# Altium schematic sheet Controller_Sheet.SchDoc
size 420 x 297 mm; SheetNumber: 6; SheetTotal: 6
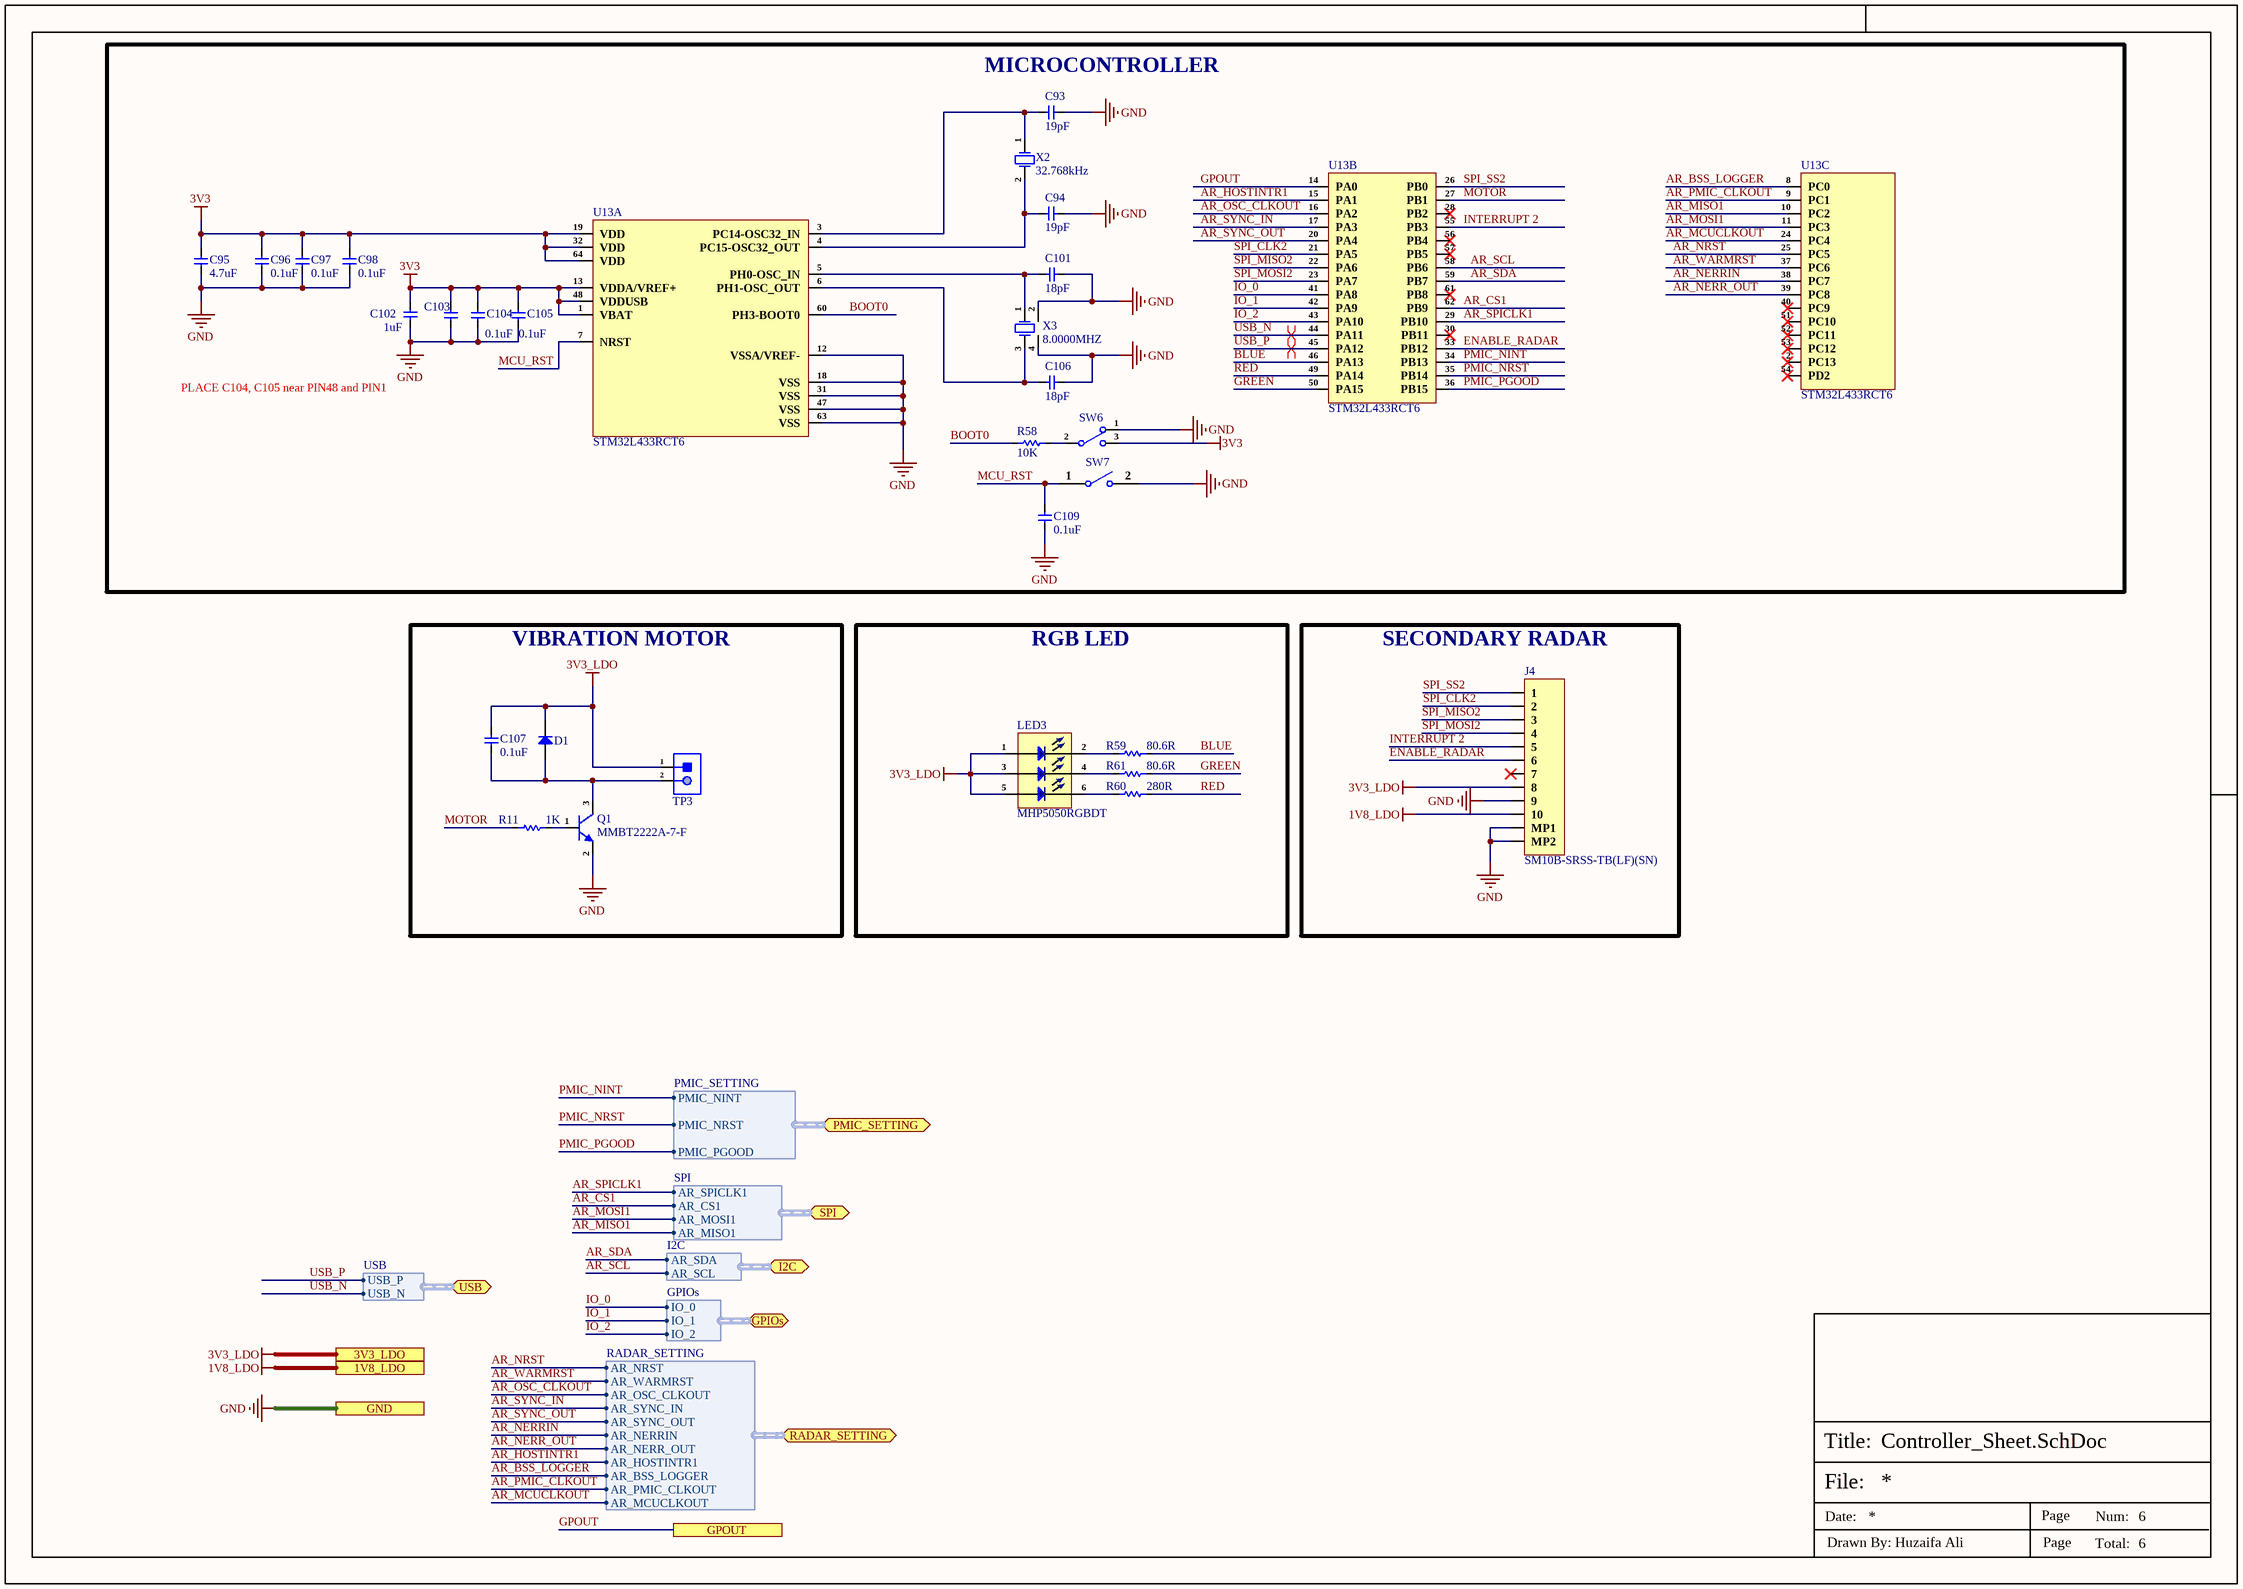
[diagram p0: Controller_Sheet.SchDoc]

## Parts
C93  19pF  [Cap-0402]
C94  19pF  [Cap-0402]
C95  4.7uF  [Cap-0603]
C96  0.1uF  [Cap-0402]
C97  0.1uF  [Cap-0402]
C98  0.1uF  [Cap-0402]
C101  18pF  [CAP-0201]
C102  1uF  [Cap-0402]
C103  10nF  [Cap-0402]  (value not drawn)
C104  0.1uF  [Cap-0402]
C105  0.1uF  [Cap-0402]
C106  18pF  [CAP-0201]
C107  0.1uF  [Cap-0402]
C109  0.1uF  [Cap-0402]
D1  1N4001  [SMA(DO-214AC)]  (value not drawn)
J4  SM10B-SRSS-TB(LF)(SN)  [SM10B-SRSS-TB(LF)(SN)]
LED3  MHP5050RGBDT  [SMD5050]
Q1  MMBT2222A-7-F  [SOT-23]
R11  1K  [Res-0201]
R58  10K  [Res-0402]
R59  80.6R  [Res-0402]
R60  280R  [Res-0402]
R61  80.6R  [Res-0402]
SW6  CL-SB-12B-02T  [CL-SB-12B-02T]  (value not drawn)
SW7  B3U-1000P  [B3U-1000P]  (value not drawn)
TP3  2 Test Pad  [2 Test Pad]  (value not drawn)  (no BOM)
U13  STM32L433RCT6  [64-LQFP (10x10)]  (parts A,B,C of 3)
X2  32.768kHz  [SMD1610-2P]
X3  8.0000MHZ  [SMD3225-4P]

## Blocks framed on the sheet
MICROCONTROLLER: C93-C98 C101-C106 C109 R58 SW6 SW7 U13 X2 X3
VIBRATION MOTOR: C107 D1 Q1 R11 TP3
RGB LED: LED3 R59-R61
SECONDARY RADAR: J4

## Ports
1V8_LDO, 3V3_LDO, GND, GPIOs (bidir, harness GPIOs), GPOUT, I2C (bidir, harness I2C), PMIC_SETTING (bidir, harness PMIC_SETTING), RADAR_SETTING (bidir, harness RADAR_SETTING), SPI (bidir, harness SPI), USB (bidir, harness USB)

## Harnesses
USB: USB_P, USB_N
GPIOs: IO_0, IO_1, IO_2
I2C: AR_SDA, AR_SCL
SPI: AR_SPICLK1, AR_CS1, AR_MOSI1, AR_MISO1
PMIC_SETTING: PMIC_NINT, PMIC_NRST, PMIC_PGOOD
RADAR_SETTING: AR_NRST, AR_WARMRST, AR_OSC_CLKOUT, AR_SYNC_IN, AR_SYNC_OUT, AR_NERRIN, AR_NERR_OUT, AR_HOSTINTR1, AR_BSS_LOGGER, AR_PMIC_CLKOUT, AR_MCUCLKOUT

## Nets
1V8_LDO: J4.10 ; port 1V8_LDO
3V3: C95.2 C96.2 C97.2 C98.2 C102.1 C103.2 C104.2 C105.2 SW6.3(NO) U13.1(VBAT) U13.13(VDDA/VREF+) U13.19(VDD) U13.32(VDD) U13.48(VDDUSB) U13.64(VDD)
3V3_LDO: C107.2 D1.1(K) J4.8 LED3.1 LED3.3 LED3.5 TP3.1 ; port 3V3_LDO
GND: C93.2 C94.2 C95.1 C96.1 C97.1 C98.1 C101.1 C102.2 C103.1 C104.1 C105.1 C106.1 C109.1 J4.9 J4.MP1 J4.MP2 Q1.2(E) SW6.1(NC) SW7.2 U13.12(VSSA/VREF-) U13.18(VSS) U13.31(VSS) U13.47(VSS) U13.63(VSS) X3.2(GND) X3.4(GND) ; port GND
AR_BSS_LOGGER: U13.8(PC0) ; port RADAR_SETTING.AR_BSS_LOGGER
AR_CS1: U13.62(PB9) ; port SPI.AR_CS1
AR_HOSTINTR1: U13.15(PA1) ; port RADAR_SETTING.AR_HOSTINTR1
AR_MCUCLKOUT: U13.24(PC4) ; port RADAR_SETTING.AR_MCUCLKOUT
AR_MISO1: U13.10(PC2) ; port SPI.AR_MISO1
AR_MOSI1: U13.11(PC3) ; port SPI.AR_MOSI1
AR_NERR_OUT: U13.39(PC8) ; port RADAR_SETTING.AR_NERR_OUT
AR_NERRIN: U13.38(PC7) ; port RADAR_SETTING.AR_NERRIN
AR_NRST: U13.25(PC5) ; port RADAR_SETTING.AR_NRST
AR_OSC_CLKOUT: U13.16(PA2) ; port RADAR_SETTING.AR_OSC_CLKOUT
AR_PMIC_CLKOUT: U13.9(PC1) ; port RADAR_SETTING.AR_PMIC_CLKOUT
AR_SCL: U13.58(PB6) ; port I2C.AR_SCL
AR_SDA: U13.59(PB7) ; port I2C.AR_SDA
AR_SPICLK1: U13.29(PB10) ; port SPI.AR_SPICLK1
AR_SYNC_IN: U13.17(PA3) ; port RADAR_SETTING.AR_SYNC_IN
AR_SYNC_OUT: U13.20(PA4) ; port RADAR_SETTING.AR_SYNC_OUT
AR_WARMRST: U13.37(PC6) ; port RADAR_SETTING.AR_WARMRST
BLUE: R59.2 U13.46(PA13)
BOOT0: R58.2 U13.60(PH3-BOOT0)
ENABLE_RADAR: J4.6 U13.33(PB12)
GPOUT: U13.14(PA0) ; port GPOUT
GREEN: R61.2 U13.50(PA15)
INTERRUPT 2: J4.5 U13.55(PB3)
IO_0: U13.41(PA8) ; port GPIOs.IO_0
IO_1: U13.42(PA9) ; port GPIOs.IO_1
IO_2: U13.43(PA10) ; port GPIOs.IO_2
MCU_RST: C109.2 SW7.1 U13.7(NRST)
MOTOR: R11.2 U13.27(PB1)
PMIC_NINT: U13.34(PB13) ; port PMIC_SETTING.PMIC_NINT
PMIC_NRST: U13.35(PB14) ; port PMIC_SETTING.PMIC_NRST
PMIC_PGOOD: U13.36(PB15) ; port PMIC_SETTING.PMIC_PGOOD
RED: R60.2 U13.49(PA14)
SPI_CLK2: J4.2 U13.21(PA5)
SPI_MISO2: J4.3 U13.22(PA6)
SPI_MOSI2: J4.4 U13.23(PA7)
SPI_SS2: J4.1 U13.26(PB0)
USB_N: U13.44(PA11) ; port USB.USB_N
USB_P: U13.45(PA12) ; port USB.USB_P
NetC93_1: C93.1 U13.3(PC14-OSC32_IN) X2.1(OSC1)
NetC94_1: C94.1 U13.4(PC15-OSC32_OUT) X2.2(OSC2)
NetC101_2: C101.2 U13.5(PH0-OSC_IN) X3.1(IN/OUT)
NetC106_2: C106.2 U13.6(PH1-OSC_OUT) X3.3(Out/In)
NetC107_1: C107.1 D1.2(A) Q1.3(C) TP3.2
NetLED3_2: LED3.2 R59.1
NetLED3_4: LED3.4 R61.1
NetLED3_6: LED3.6 R60.1
NetQ1_1: Q1.1(B) R11.1
NetR58_1: R58.1 SW6.2(COM)

Not connected (* = marked no-connect by the designer): J4 7*; U13 2(PC13)* 28(PB2)* 30(PB11)* 40(PC9)* 51(PC10)* 52(PC11)* 53(PC12)* 54(PD2)* 56(PB4)* 57(PB5)* 61(PB8)*

## Layout directives
differential pair; net class USB; differential pair class USB_Lines; rule Impedance Constraint [Min = 88.00    Max = 90.00    ]; rule Matched Net Lengths [Tolerance = 20mil]: USB_N, USB_P

## Notes on the sheet
- PLACE C104, C105 near PIN48 and PIN1
- File:
- Title:
- Date:
- Page
- Num:
- Total:
- Drawn By: Huzaifa Ali

## Library data of the parts
C93 C94 = GJM1555C1H190GB01D: CAP CER 19PF 50V C0G/NP0 0402; Manufacturer: Murata; Item Type: Ceramic Capacitors; Supplier: Mouser; Supplier Part Number: 81-GJM1555C1H190GB1D; Manufacturer Part Number: GJM1555C1H190GB01D; RoHS: Yes; Stock: 2045; Pricing: 1=0.13, 10=0.082, 50=0.082, 100=0.042, 1000=0.027, 10000=0.02 (USD)
C95 = CC0603KRX5R7BB475: CAP CER 4.7UF 16V X5R 0603; Manufacturer: Yageo; Tolerance: 10%; Item Type: Capacitor; Supplier 1: Digi-Key; Manufacturer Part Number: CC0603KRX5R7BB475; RoHS: Yes; Category: Ceramic Capacitors; Stock 1: 547703; Pricing 1: 1=0.20000, 10=0.13800, 50=0.08280, 100=0.06990, 500=0.04784, 1000=0.04233 (USD); Mount: Surface Mount; Case/Package: 0603; Case Code (Imperial): 0603; Case Code (Metric): 1608; Weight: 7.1E-05oz; Min Operating Temperature: -55°C; Max Operating Temperature: 85°C; Capacitance: 4.7uF; Voltage Rating: 16V; Voltage Rating (DC): 16V; Packaging: Tape and Reel; Dielectric: X5R; Termination: SMD/SMT; Resistor Type: Ceramic; Series: CC; Length: 1.6mm; Width: 0.8mm; Height: 0.8mm; Thickness: 0.037inch; Depth: 0.8mm; Lead Free: Lead Free; Halogen Free: Halogen Free; RoHS Compliant: Yes; ComponentLink1URL: http://www.mouser.com/ds/2/447/UPY-GPHC_X5R_4V-to-50V_25-1131599.pdf?src-supplier=Mouser; ComponentLink1Description: http://www.mouser.com/ds/2/447/UPY-GPHC_X5R_4V-to-50V_25-1131599.pdf?src-supplier=Mouser; ComponentLink2URL: http://www.yageo.com/documents/recent/UPY-GPHC_X5R_4V-to-50V_25.pdf?src-supplier=Digi-Key; ComponentLink2Description: http://www.yageo.com/documents/recent/UPY-GPHC_X5R_4V-to-50V_25.pdf?src-supplier=Digi-Key; Supplier Part Number 1: 311-1785-1-ND; LCSC Part Number: C277476
C96-C98 C104 C105 C107 C109 = CC0402JRX7R7BB104: CAP CER 0.1UF 16V X7R 0402; Manufacturer: Yageo; Material: 4241ConductorMaterial; Value: 100nF; Tolerance: 5%; Item Type: Capacitor; Supplier: Digikey; Supplier Part Number: 311-1676-1-ND; Manufacturer Part Number: CC0402JRX7R7BB104; RoHS: Yes; Category: Ceramic Capacitors; Stock: 1659111; Pricing: 1=0.1, 10=0.046, 50=0.0262, 100=0.0203, 500=0.01528, 1000=0.012, 2500=0.01091, 5000=0.01004 (USD); Mounting Technology: Surface Mount; Case/Package: 0402; Case Code (Metric): 1005; Case Code (Imperial): 0402; Min Operating Temperature: -55°C; Max Operating Temperature: 125°C; Dielectric: X7R; Packaging: Tape and Reel; Package Quantity: 10000; Voltage Rating (DC): 16V; Voltage Rating: 16V; Series: CC; Construction: Flat; Length: 0.039inch; Width: 0.02inch; Height: 0.5mm; Thickness: 0.022inch; Lead Free: Lead Free; Halogen Free: Halogen Free; RoHS Compliant: Yes; ComponentLink1URL: https://datasheet.ciiva.com/13210/upy-gphc-x7r-6-3v-to-50v-8-12304-13210152.pdf?src-supplier=Mouser; ComponentLink1Description: https://datasheet.ciiva.com/13210/upy-gphc-x7r-6-3v-to-50v-8-12304-13210152.pdf?src-supplier=Mouser; LCSC Part Number: C541464
C101 C106 = GJM0335C1E180GB01D: CAP CER 18PF 25V C0G/NP0 0201; Manufacturer: Murata Electronics; Item Type: Capacitor; Manufacturer Part Number: GJM0335C1E180GB01D; Package: 0201; LCSC Part Number: C913481; ComponentLink1Description: LCSC; Supplier: Rs; Supplier Part Number: 1853317; RoHS: Yes; Category: Ceramic Capacitors; Stock: 15000; Pricing: 1000=0.018, 5000=0.015, 10000=0.012 (GBP); ComponentLink2URL: http://www.mouser.com/ds/2/281/c02e-2905.pdf?src-supplier=Mouser; ComponentLink2Description: http://www.mouser.com/ds/2/281/c02e-2905.pdf?src-supplier=Mouser; ComponentLink3URL: https://datasheet.octopart.com/GJM0335C1E180GB01D-Murata-datasheet-22122223.pdf?src-supplier=Future+Electronics; ComponentLink3Description: https://datasheet.octopart.com/GJM0335C1E180GB01D-Murata-datasheet-22122223.pdf?src-supplier=Future+Electronics; ComponentLink4URL: https://search.murata.co.jp/Ceramy/image/img/A01X/G101/ENG/GJM0335C1E180GB01-01.pdf?src-supplier=Digi-Key; ComponentLink4Description: https://search.murata.co.jp/Ceramy/image/img/A01X/G101/ENG/GJM0335C1E180GB01-01.pdf?src-supplier=Digi-Key; ComponentLink5URL: http://search.murata.co.jp/Ceramy/image/img/A01X/G101/ENG/GJM0335C1E180GB01-01.pdf?src-supplier=Digi-Key; ComponentLink5Description: http://search.murata.co.jp/Ceramy/image/img/A01X/G101/ENG/GJM0335C1E180GB01-01.pdf?src-supplier=Digi-Key; ComponentLink6URL: https://datasheet.octopart.com/GJM0335C1E180GB01D-Murata-datasheet-12511495.pdf?src-supplier=TME; ComponentLink6Description: https://datasheet.octopart.com/GJM0335C1E180GB01D-Murata-datasheet-12511495.pdf?src-supplier=TME
C102 = CC0402KRX5R7BB105: CAP CER 1UF 16V X5R 0402; Manufacturer: Yageo; Tolerance: 10%; Item Type: Capacitor; Supplier 1: Digi-Key; Manufacturer Part Number: CC0402KRX5R7BB105; Stock 1: 1405667; Pricing 1: 1=0.36, 10=0.252, 100=0.1512, 500=0.1134, 1000=0.09576, 2500=0.09072, 5000=0.08568 (USD); Mount: Surface Mount; Case/Package: 0402; Weight: 2.3E-05oz; Case Code (Imperial): 0402; Case Code (Metric): 1005; Min Operating Temperature: -55°C; Max Operating Temperature: 85°C; Capacitance: 1uF; Dielectric: X5R; Packaging: Tape and Reel; Voltage Rating (DC): 16V; Voltage Rating: 16V; Termination: SMD/SMT; Composition: Ceramic; Length: 1mm; Height: 0.5mm; Width: 0.02inch; Thickness: 0.022inch; Depth: 0.5mm; Radiation Hardening: No; Lead Free: Lead Free; Halogen Free: Halogen Free; ComponentLink1URL: http://www.yageo.com/documents/recent/UPY-GPHC_X5R_4V-to-50V_12.pdf?src-supplier=Avnet+Europe; ComponentLink1Description: http://www.yageo.com/documents/recent/UPY-GPHC_X5R_4V-to-50V_12.pdf?src-supplier=Avnet+Europe; Supplier Part Number 1: 311-1691-6-ND; LCSC Part Number: C325464
C103 = CC0402KRX7R8BB103: CAP CER 10000PF 25V X7R 0402; Manufacturer: Yageo; Tolerance: 10%; Supplier 1: Digi-Key; Manufacturer Part Number: CC0402KRX7R8BB103; Stock 1: 0; Pricing 1: 1=0.1, 10=0.021, 100=0.0093, 500=0.00666, 1000=0.00523, 2500=0.00476, 5000=0.00438 (USD); Mount: Surface Mount; Case/Package: 0402; Case Code (Metric): 1005; Case Code (Imperial): 0402; Min Operating Temperature: -55°C; Max Operating Temperature: 125°C; Capacitance: 10nF; Dielectric: X7R; Voltage Rating: 25V; Package Quantity: 1; Packaging: Tape and Reel; Voltage Rating (DC): 25V; Termination: SMD/SMT; Composition: Ceramic; Length: 1mm; Height: 0.5mm; Depth: 0.5mm; Width: 0.02inch; Thickness: 0.022inch; Radiation Hardening: No; REACH SVHC: Unknown; Lead Free: Lead Free; Halogen Free: Halogen Free; ComponentLink1URL: http://www.yageo.com/documents/recent/UPY-GPHC_X7R_6.3V-to-50V_18.pdf?src-supplier=Digi-Key; ComponentLink1Description: http://www.yageo.com/documents/recent/UPY-GPHC_X7R_6.3V-to-50V_18.pdf?src-supplier=Digi-Key; ComponentLink2URL: https://www.verical.com/server-webapp/html/getDatasheet?partID=375418&src-supplier=Verical; ComponentLink2Description: https://www.verical.com/server-webapp/html/getDatasheet?partID=375418&src-supplier=Verical; ComponentLink3URL: http://www.yageo.com/documents/recent/UPY-GPHC_X7R_6.3V-to-50V_8.pdf?src-supplier=Avnet; ComponentLink3Description: http://www.yageo.com/documents/recent/UPY-GPHC_X7R_6.3V-to-50V_8.pdf?src-supplier=Avnet; ComponentLink4URL: https://4donline.ihs.com/images/VipMasterIC/IC/YAGO/YAGO-S-A0003557223/YAGO-S-A0003557223-1.pdf?hkey=52A5661711E402568146F3353EA87419&src-supplier=Element14; ComponentLink4Description: https://4donline.ihs.com/images/VipMasterIC/IC/YAGO/YAGO-S-A0003557223/YAGO-S-A0003557223-1.pdf?hkey=52A5661711E402568146F3353EA87419&src-supplier=Element14; ComponentLink5URL: http://www.farnell.com/datasheets/2167236.pdf?src-supplier=Element14; ComponentLink5Description: http://www.farnell.com/datasheets/2167236.pdf?src-supplier=Element14; ComponentLink6URL: http://www.mouser.com/ds/2/447/Yageo_UPY-GP_NP0_16V-to-50V_9-358835.pdf?src-supplier=Mouser; ComponentLink6Description: http://www.mouser.com/ds/2/447/Yageo_UPY-GP_NP0_16V-to-50V_9-358835.pdf?src-supplier=Mouser; Supplier Part Number 1: 311-1337-1-ND; LCSC Part Number: C327025
D1 = 1N4001: 1A Single 50V 1.1V@1A SMA(DO-214AC) Diodes - General Purpose ROHS; Manufacturer: TWGMC; Item Type: Diode; Manufacturer Part Number: 1N4001; Package: SMA(DO-214AC); LCSC Part Number: C727079; ComponentLink1Description: LCSC; ComponentLink1URL: https://www.lcsc.com/product-detail/Diodes-General-Purpose_TWGMC-1N4001_C727079.html
J4 = SM10B-SRSS-TB(LF)(SN): CONN HEADER SMD R/A 10POS 1MM; Manufacturer: JST; Contact Resistance: 40mR; Current Rating: 1A; Voltage Rating (AC): 50V; Gender: Male; Number of Positions: 10; Insulation Resistance: 100MR; Item Type: JST Connector; Supplier 1: Future Electronics; Manufacturer Part Number: SM10B-SRSS-TB(LF)(SN); RoHS: Yes; Category: Connectors; Pricing 1: 3000=0.64500 (USD); Mount: Surface Mount; Contact Plating: Tin,Lead,Copper; Contact Material: Copper Alloy; Color: Natural; Material: Polyamide; Housing Color: Beige; Housing Material: Polyamide; Contact Shape: Square; Contact Finish - Mating: TIN; Insulation Material: Nylon; Insulation Color: Natural; Min Operating Temperature: -25°C; Max Operating Temperature: 85°C; Number of Rows: 1; Packaging: Tape and Reel; Max Current Rating: 1A; Voltage Rating: 50V; Termination: Solder; Max Voltage Rating (AC): 50V; Number of Contacts: 10; Orientation: Right Angle; Connector Type: Header; Series: SR; Contact Type: Male Pin; Fastening Type: Pull; Length: 12mm; Lead Pitch: 1mm; Pitch: 1mm; Depth: 4.95mm; Reach SVHC Compliant: Yes; Lead Free: Lead Free; Flammability Rating: UL94 V-0; ComponentLink1URL: https://datasheet.ciiva.com/26894/getdatasheetpartid-708886-26894682.pdf?src-supplier=Verical; ComponentLink1Description: https://datasheet.ciiva.com/26894/getdatasheetpartid-708886-26894682.pdf?src-supplier=Verical; ComponentLink2URL: https://datasheet.ciiva.com/16221/sm10b-srss-tblfsn-16221242.pdf?src-supplier=Future+Electronics; ComponentLink2Description: https://datasheet.ciiva.com/16221/sm10b-srss-tblfsn-16221242.pdf?src-supplier=Future+Electronics; ComponentLink3URL: https://datasheet.ciiva.com/11752/0900766b8082f550-11752172.pdf?src-supplier=RSComponents; ComponentLink3Description: https://datasheet.ciiva.com/11752/0900766b8082f550-11752172.pdf?src-supplier=RSComponents; ComponentLink4URL: https://datasheet.ciiva.com/712/esr-712644.pdf?src-supplier=Digi-Key; ComponentLink4Description: https://datasheet.ciiva.com/712/esr-712644.pdf?src-supplier=Digi-Key; ComponentLink5URL: https://datasheet.ciiva.com/712/esr-712645.pdf?src-supplier=Digi-Key; ComponentLink5Description: https://datasheet.ciiva.com/712/esr-712645.pdf?src-supplier=Digi-Key; ComponentLink6URL: https://datasheet.ciiva.com/730/esr-730692.pdf?src-supplier=Digi-Key; ComponentLink6Description: https://datasheet.ciiva.com/730/esr-730692.pdf?src-supplier=Digi-Key; Supplier Part Number 1: 1165778; LCSC Part Number: C160409
LED3 = MHP5050RGBDT: 20mA White Diffused -40℃~+85℃ RGB SMD5050 Light Emitting Diodes (LED) ROHS; Manufacturer: MEIHUA; Item Type: RGB LED; Manufacturer Part Number: MHP5050RGBDT; LCSC Part Number: C409780; Package: SMD5050; ComponentLink1Description: LCSC; ComponentLink1URL: https://www.lcsc.com/product-detail/Light-Emitting-Diodes-LED_MEIHUA-MHP5050RGBDT_C409780.html
Q1 = MMBT2222A-7-F: TRANS NPN 40V 0.6A SMD SOT23-3; Manufacturer: Diodes; Max Power Dissipation: 300mW; Collector Base Voltage (VCBO): 75V; Max Collector Current: 600mA; hFE Min: 100; Frequency: 300MHz; Number of Elements: 1; Emitter Base Voltage (VEBO): 6V; Collector Emitter Saturation Voltage: 1V; Power Dissipation: 350mW; Element Configuration: Single; Current: 1A; Item Type: Mosfet; Supplier 1: Digi-Key; Manufacturer Part Number: MMBT2222A-7-F; Stock 1: 2471182; Pricing 1: 1=0.15, 10=0.134, 100=0.0729, 500=0.04486, 1000=0.03059 (USD); Mount: Surface Mount; Case/Package: SOT-23; Number of Pins: 3; Weight: 0.000282oz; Contact Plating: Matte,Tin; Min Operating Temperature: -55°C; Max Operating Temperature: 150°C; Packaging: Tape and Reel; Collector Emitter Voltage (VCEO): 40V; Polarity: NPN; Voltage Rating (DC): 40V; Package Quantity: 3000; Continuous Collector Current: 600mA; Collector Emitter Breakdown Voltage: 40V; Transition Frequency: 300MHz; Max Breakdown Voltage: 40V; Max Frequency: 300MHz; Termination: SMD/SMT; Gain Bandwidth Product: 300MHz; Current Rating: 600mA; Voltage: 40V; Length: 3.05mm; Height: 1mm; Width: 1.4mm; Radiation Hardening: No; Lead Free: Lead Free; REACH SVHC: No SVHC; ComponentLink1URL: http://www.diodes.com/datasheets/ds30041.pdf?src-supplier=Future+Electronics; ComponentLink1Description: http://www.diodes.com/datasheets/ds30041.pdf?src-supplier=Future+Electronics; ComponentLink2URL: http://www.diodes.com/datasheets/ds30041.pdf?src-supplier=Avnet; ComponentLink2Description: http://www.diodes.com/datasheets/ds30041.pdf?src-supplier=Avnet; ComponentLink3URL: https://www.verical.com/server-webapp/html/getDatasheet?partID=82692&src-supplier=Verical; ComponentLink3Description: https://www.verical.com/server-webapp/html/getDatasheet?partID=82692&src-supplier=Verical; ComponentLink4URL: https://www.diodes.com/assets/Datasheets/ds30041.pdf?src-supplier=Digi-Key; ComponentLink4Description: https://www.diodes.com/assets/Datasheets/ds30041.pdf?src-supplier=Digi-Key; ComponentLink5URL: http://www.diodes.com/datasheets/ds30041.pdf?src-supplier=Avnet+Europe; ComponentLink5Description: http://www.diodes.com/datasheets/ds30041.pdf?src-supplier=Avnet+Europe; ComponentLink6URL: http://www.diodes.com/datasheets/ds30041.pdf?src-supplier=Element14; ComponentLink6Description: http://www.diodes.com/datasheets/ds30041.pdf?src-supplier=Element14; Supplier Part Number 1: MMBT2222A-FDIDKR-ND; LCSC Part Number: C94515
R11 = RC0201FR-071KL: RES 1K OHM 1% 1/20W 0201; Manufacturer: Yageo; Value: 1kR; Temperature Coefficient: 200ppm/°C; Power Rating: 50mW; Voltage Rating: 25V; Item Type: Resistor; Supplier: Digi-Key; Supplier Part Number: 311-1KMCT-ND; Manufacturer Part Number: RC0201FR-071KL; RoHS: Yes; Category: Chip SMD Resistors; Stock: 5606340; Pricing: 1=0.1, 10=0.027, 50=0.0172, 100=0.0143, 500=0.00988, 1000=0.00854, 5000=0.00629 (USD); Case/Package: 0201; Contact Plating: Tin,Matte; Case Code (Metric): 0603; Case Code (Imperial): 0201; Min Operating Temperature: -55°C; Max Operating Temperature: 125°C; Tolerance: 1%; Resistor Type: Thick Film; Package Quantity: 10000; Packaging: Tape and Reel; Number of Terminations: 2; Termination: SMD/SMT; Max Power Dissipation: 50mW; Working Voltage: 25V; Features: Moisture Resistant; Series: RC; Resistance Tolerance: 1%; Technology: THICK FILM; Construction: Rectangular; Voltage Rating (DC): 25V; Length: 0.024inch; Width: 0.012inch; Height: 0.01inch; Depth: 0.3mm; Military Standard: Not; RoHS Compliant: Yes; Reach SVHC Compliant: Unknown; Lead Free: 5697LeadFree; ComponentLink1URL: https://datasheet.ciiva.com/7672/1563626-7672204.pdf?src-supplier=Element14; ComponentLink1Description: https://datasheet.ciiva.com/7672/1563626-7672204.pdf?src-supplier=Element14; ComponentLink2URL: https://datasheet.ciiva.com/22698/1563626-22698505.pdf?src-supplier=Element14; ComponentLink2Description: https://datasheet.ciiva.com/22698/1563626-22698505.pdf?src-supplier=Element14; ComponentLink3URL: https://datasheet.ciiva.com/29721/pyu-r-int-thick-7-29721196.pdf?src-supplier=Digi-Key; ComponentLink3Description: https://datasheet.ciiva.com/29721/pyu-r-int-thick-7-29721196.pdf?src-supplier=Digi-Key; ComponentLink4URL: https://datasheet.ciiva.com/29721/pyu-r-int-thick-7-29721195.pdf?src-supplier=Digi-Key; ComponentLink4Description: https://datasheet.ciiva.com/29721/pyu-r-int-thick-7-29721195.pdf?src-supplier=Digi-Key; ComponentLink5URL: https://datasheet.ciiva.com/8896/pyu-rc0201-51-rohs-l-8-8896174.pdf?src-supplier=Avnet; ComponentLink5Description: https://datasheet.ciiva.com/8896/pyu-rc0201-51-rohs-l-8-8896174.pdf?src-supplier=Avnet; LCSC Part Number: C138165
R58 = RC0402FR-0710KL: RES 10K OHM 1% 1/16W 0402; Manufacturer: Yageo; Resistance: 10kR; Voltage Rating (DC): 50V; Temperature Coefficient: 100ppm/°C; Power Rating: 62.5mW; Max Power Dissipation: 63mW; Item Type: Resistor; Supplier 1: Mouser; Manufacturer Part Number: RC0402FR-0710KL; RoHS: Yes; Category: Chip SMD Resistors; Stock 1: 18648329; Pricing 1: 1=0.10000, 10=0.01400, 50=0.01400, 100=0.00500, 1000=0.00300, 10000=0.00200 (USD); Case/Package: 0402; Number of Pins: 2; Case Code (Imperial): 0402; Case Code (Metric): 1005; Min Operating Temperature: -55°C; Max Operating Temperature: 155°C; Resistor Type: Thick Film; Tolerance: 1%; Packaging: Tape and Reel; Voltage Rating: 50V; Termination: SMD/SMT; Working Voltage: 50V; Number of Terminations: 2; Features: Moisture Resistant; Series: RC; Resistance Tolerance: 1%; Construction: Rectangular; Length: 1mm; Width: 0.5mm; Height: 0.32mm; Depth: 0.5mm; Lead Pitch: 0.2mm; REACH SVHC: No SVHC; Lead Free: Lead Free; RoHS Compliant: Yes; Military Standard: Not; ComponentLink1URL: https://datasheet.ciiva.com/7660/38568-7660787.pdf?src-supplier=Element14; ComponentLink1Description: https://datasheet.ciiva.com/7660/38568-7660787.pdf?src-supplier=Element14; ComponentLink2URL: https://datasheet.ciiva.com/7849/1686128-7849814.pdf?src-supplier=Element14; ComponentLink2Description: https://datasheet.ciiva.com/7849/1686128-7849814.pdf?src-supplier=Element14; ComponentLink3URL: https://datasheet.ciiva.com/7983/1018594-7983486.pdf?src-supplier=Element14; ComponentLink3Description: https://datasheet.ciiva.com/7983/1018594-7983486.pdf?src-supplier=Element14; ComponentLink4URL: https://datasheet.ciiva.com/22747/1018594-22747512.pdf?src-supplier=Element14; ComponentLink4Description: https://datasheet.ciiva.com/22747/1018594-22747512.pdf?src-supplier=Element14; ComponentLink5URL: https://datasheet.ciiva.com/12667/pyu-rc0402-51-rohs-l-6-r-12667067.pdf?src-supplier=Mouser; ComponentLink5Description: https://datasheet.ciiva.com/12667/pyu-rc0402-51-rohs-l-6-r-12667067.pdf?src-supplier=Mouser; ComponentLink6URL: https://datasheet.ciiva.com/7849/1784430-7849813.pdf?src-supplier=Element14; ComponentLink6Description: https://datasheet.ciiva.com/7849/1784430-7849813.pdf?src-supplier=Element14; ComponentLink7URL: https://datasheet.ciiva.com/7849/1784430-7849815.pdf?src-supplier=Element14; ComponentLink7Description: https://datasheet.ciiva.com/7849/1784430-7849815.pdf?src-supplier=Element14; Supplier Part Number 1: 603-RC0402FR-0710KL; LCSC Part Number: C60490
R59 R61 = RN73H1ETTP80R6F50: Res 80.6 Ohm 1% 1/16W 0402; Manufacturer: KOA Speer; Item Type: Resistor; Power Rating: 63mW; Voltage Rating: 50V; Temperature Coefficient: 50ppm/°C; Supplier: Digikey; Supplier Part Number: 2019-RN73H1ETTP80R6F50CT-ND; Manufacturer Part Number: RN73H1ETTP80R6F50; RoHS: Yes; Pricing: 1000=0.08675 (USD); Case/Package: 0402; Case Code (Imperial): 0402; Case Code (Metric): 1005; Weight: 2.3E-05oz; Min Operating Temperature: -55°C; Max Operating Temperature: 155°C; Value: 80.6R; Packaging: Tape and Reel; Tolerance: 1%; Termination: SMD/SMT; Voltage Rating (DC): 50V; Series: RN73H; Length: 1mm; Width: 0.5mm; Height: 0.35mm; RoHS Compliant: Yes; ComponentLink1URL: http://www.mouser.com/ds/2/219/RN73H-12200.pdf?src-supplier=Mouser; ComponentLink1Description: http://www.mouser.com/ds/2/219/RN73H-12200.pdf?src-supplier=Mouser
R60 = RN73H1ETTP2800D50: RES 280 OHM 0.5% 1/16W 0402; Manufacturer: KOA Speer; Item Type: Resistor; Power Rating: 63mW; Voltage Rating: 50V; Temperature Coefficient: 50ppm/°C; Supplier: Digikey; Supplier Part Number: 2019-RN73H1ETTP2800D50CT-ND; Manufacturer Part Number: RN73H1ETTP2800D50; RoHS: Yes; Pricing: 1000=0.08675 (USD); Case/Package: 0402; Case Code (Imperial): 0402; Case Code (Metric): 1005; Min Operating Temperature: -55°C; Max Operating Temperature: 155°C; Value: 280R; Packaging: Tape and Reel; Tolerance: 0.5%; Termination: SMD/SMT; Voltage Rating (DC): 50V; Series: RN73H; Length: 1mm; Width: 0.5mm; Height: 0.35mm; RoHS Compliant: Yes; ComponentLink1URL: http://www.koaspeer.com/catimages/Products/RN73H/RN73H.pdf?src-supplier=Mouser; ComponentLink1Description: http://www.koaspeer.com/catimages/Products/RN73H/RN73H.pdf?src-supplier=Mouser
SW6 = CL-SB-12B-02T: SWITCH SLIDE SPDT 200MA 12V; Manufacturer: Nidec Copal; Actuator Material: Nylon,Polyamide; Operating Force: 153gf; Electrical Life: 10000Cycles; Switch Travel: 2mm; Switch Function: On-On; Actuator Type: Standard; Item Type: Slide Switche; Supplier: Digikey; Supplier Part Number: 563-1319-1-ND; Manufacturer Part Number: CL-SB-12B-02T; RoHS: Yes; Category: Slide Switches; Stock: 2449; Pricing: 1=1.67, 10=1.62, 25=1.4732, 100=1.2799, 250=1.15988 (USD); Mounting Technology: Surface Mount; Contact Material: Copper; Contact Plating: Gold; Min Operating Temperature: -40°C; Max Operating Temperature: 85°C; Packaging: Cut Tape; Voltage Rating (DC): 12V; Termination: Gull Wing; Throw Configuration: SPDT; Series: CL-SB; Actuator Length: 2mm; RoHS Compliant: Yes; ComponentLink1URL: https://datasheet.ciiva.com/6461/cl-sb-6461724.pdf?src-supplier=Digikey; ComponentLink1Description: https://datasheet.ciiva.com/6461/cl-sb-6461724.pdf?src-supplier=Digikey; ComponentLink2URL: https://datasheet.ciiva.com/6461/cl-sb-6461725.pdf?src-supplier=Digikey; ComponentLink2Description: https://datasheet.ciiva.com/6461/cl-sb-6461725.pdf?src-supplier=Digikey; ComponentLink3URL: https://datasheet.ciiva.com/6461/cl-sb-6461726.pdf?src-supplier=Digikey; ComponentLink3Description: https://datasheet.ciiva.com/6461/cl-sb-6461726.pdf?src-supplier=Digikey; LCSC Part Number: C2921648
SW7 = B3U-1000P: SWITCH TACTILE SPST-NO 0.05A 12V; Manufacturer: Omron; Mechanical Life: 200000Cycles; Operating Force: 1.5N; Throw Configuration: SPST; Current Rating: 50mA; Contact Resistance: 100mR; Illumination Type: Non-Illuminated,Illuminated; Switch Travel: 0.15mm; Switch Function: Off-Mom; Actuator Type: Standard; Actuator Length: 0.4mm; Ratings: Dust Proof,IP40; ComponentLink1URL: http://www.farnell.com/datasheets/60838.pdf?src-supplier=Farnell; ComponentLink1Description: http://www.farnell.com/datasheets/60838.pdf?src-supplier=Farnell; ComponentLink2URL: http://www.farnell.com/datasheets/60838.pdf?src-supplier=Element14; ComponentLink2Description: http://www.farnell.com/datasheets/60838.pdf?src-supplier=Element14; ComponentLink3URL: https://omronfs.omron.com/en_US/ecb/products/pdf/en-b3u.pdf?src-supplier=Digi-Key; ComponentLink3Description: https://omronfs.omron.com/en_US/ecb/products/pdf/en-b3u.pdf?src-supplier=Digi-Key; ComponentLink4URL: http://www.omron.com/ecb/products/pdf/en-b3u.pdf?src-supplier=Digi-Key; ComponentLink4Description: http://www.omron.com/ecb/products/pdf/en-b3u.pdf?src-supplier=Digi-Key; ComponentLink5URL: https://www.distrelec.biz/Web/Downloads/he/et/B3U_eng_datasheet.pdf?mime=application%2Fpdf&src-supplier=Distrelec; ComponentLink5Description: https://www.distrelec.biz/Web/Downloads/he/et/B3U_eng_datasheet.pdf?mime=application%2Fpdf&src-supplier=Distrelec; ComponentLink6URL: http://www.onlinecomponents.com/productFiles/mf-OM/en-b3u.pdf?src-supplier=Onlinecomponents.com; ComponentLink6Description: http://www.onlinecomponents.com/productFiles/mf-OM/en-b3u.pdf?src-supplier=Onlinecomponents.com; Supplier 1: Digi-Key; Manufacturer Part Number: B3U-1000P; Stock 1: 116454; Pricing 1: 1=1, 10=0.961, 25=0.9064, 50=0.7976, 100=0.7251, 250=0.68888, 500=0.67074, 1000=0.52571 (USD); Mount: Surface Mount; Weight: 0.000776oz; Contact Material: Silver; Min Operating Temperature: -25°C; Max Operating Temperature: 70°C; Packaging: Tape and Reel; Voltage Rating (DC): 12V; Package Quantity: 1; Max Current Rating: 50mA; Termination: SMD/SMT; Orientation: Straight; Max Voltage Rating (DC): 12V; Electrical Life: 200000Cycles; Insulation Resistance: 100MR; Contact Current Rating: 50mA; Length: 4mm; Height: 1.2mm; Depth: 2.5mm; Width: 3mm; REACH SVHC: Unknown; Lead Free: Lead Free; ComponentLink7URL: https://www.verical.com/server-webapp/html/getDatasheet?partID=552554&src-supplier=Verical; ComponentLink7Description: https://www.verical.com/server-webapp/html/getDatasheet?partID=552554&src-supplier=Verical; ComponentLink8URL: http://www.farnell.com/datasheets/1685550.pdf?src-supplier=Element14; ComponentLink8Description: http://www.farnell.com/datasheets/1685550.pdf?src-supplier=Element14; ComponentLink9URL: http://www.farnell.com/datasheets/2610940.pdf?src-supplier=Farnell; ComponentLink9Description: http://www.farnell.com/datasheets/2610940.pdf?src-supplier=Farnell; ComponentLink10URL: https://www.alliedelec.com/m/d/4c8a9ef82804fc3c241a13c1e298fd73.pdf?src-supplier=Allied+Electronics; ComponentLink10Description: https://www.alliedelec.com/m/d/4c8a9ef82804fc3c241a13c1e298fd73.pdf?src-supplier=Allied+Electronics; Supplier Part Number 1: SW1020DKR-ND; LCSC Part Number: C231329; Item Type: Switch
TP3 = 2 Test Pad: Wire Connecting Pad; Item Type: Test Point; Manufacturer Part Number: 2 Test Pad
U13 = STM32L433RCT6: IC MCU 32BIT 256KB FLASH 64LQFP; Manufacturer: STMicroelectronics; Supplier 1: Mouser; Manufacturer Part Number: STM32L433RCT6; RoHS: Yes; Category: Microcontrollers; Stock 1: 2188; Pricing 1: 1=6.19, 10=5.59, 50=5.33, 100=4.63, 1000=3.46, 10000=3.46 (USD); ComponentLink1URL: http://www.farnell.com/datasheets/2581765.pdf?src-supplier=Farnell; ComponentLink1Description: http://www.farnell.com/datasheets/2581765.pdf?src-supplier=Farnell; ComponentLink2URL: http://www.farnell.com/datasheets/2581765.pdf?src-supplier=Element14; ComponentLink2Description: http://www.farnell.com/datasheets/2581765.pdf?src-supplier=Element14; ComponentLink3URL: http://www.farnell.com/datasheets/2581765.pdf?src-supplier=Newark; ComponentLink3Description: http://www.farnell.com/datasheets/2581765.pdf?src-supplier=Newark; ComponentLink4URL: http://www.st.com/content/ccc/resource/technical/document/reference_manual/group0/b0/ac/3e/8f/6d/21/47/af/DM00151940/files/DM00151940.pdf/jcr:content/translations/en.DM00151940.pdf?src-supplier=Digikey; ComponentLink4Description: http://www.st.com/content/ccc/resource/technical/document/reference_manual/group0/b0/ac/3e/8f/6d/21/47/af/DM00151940/files/DM00151940.pdf/jcr:content/translations/en.DM00151940.pdf?src-supplier=Digikey; ComponentLink5URL: https://datasheet.octopart.com/STM32L433RCT6-STMicroelectronics-datasheet-62336854.pdf?src-supplier=Future+Electronics; ComponentLink5Description: https://datasheet.octopart.com/STM32L433RCT6-STMicroelectronics-datasheet-62336854.pdf?src-supplier=Future+Electronics; ComponentLink6URL: https://datasheet.octopart.com/STM32L433RCT6-STMicroelectronics-datasheet-82526589.pdf?src-supplier=SHENGYU+ELECTRONICS; ComponentLink6Description: https://datasheet.octopart.com/STM32L433RCT6-STMicroelectronics-datasheet-82526589.pdf?src-supplier=SHENGYU+ELECTRONICS; Item type: IC; Supplier Part Number 1: 511-STM32L433RCT6
X2 = ECS-.327-12.5-16-TR: CRYSTAL 32.7680KHZ 12.5PF SMD; Manufacturer: ECS International; Supplier: Avnet; Supplier Part Number: ECS-.327-12.5-16-TR; Manufacturer Part Number: ECS-.327-12.5-16-TR; RoHS: Yes; Category: Crystals; Stock: 20000; Pricing: 5000=0.403 (USD); ComponentLink1URL: https://datasheet.octopart.com/ECS-.327-12.5-16-TR-ECS-International-datasheet-14433430.pdf?src-supplier=Future+Electronics; ComponentLink1Description: https://datasheet.octopart.com/ECS-.327-12.5-16-TR-ECS-International-datasheet-14433430.pdf?src-supplier=Future+Electronics; ComponentLink2URL: http://www.ecsxtal.com/store/pdf/ECX-16.pdf?src-supplier=Digikey; ComponentLink2Description: http://www.ecsxtal.com/store/pdf/ECX-16.pdf?src-supplier=Digikey; ComponentLink3URL: http://www.ecsxtal.com/store/pdf/partnumber4.pdf?src-supplier=Digikey; ComponentLink3Description: http://www.ecsxtal.com/store/pdf/partnumber4.pdf?src-supplier=Digikey; ComponentLink4URL: https://datasheet.octopart.com/ECS-.327-12.5-16-TR-ECS-International-datasheet-130008819.pdf?src-supplier=Master+Electronics; ComponentLink4Description: https://datasheet.octopart.com/ECS-.327-12.5-16-TR-ECS-International-datasheet-130008819.pdf?src-supplier=Master+Electronics; Item Type: Crystal
X3 = ECS-80-12-33-JGN-TR: CRYSTAL 8.0000MHZ 12PF SMD; Manufacturer: ECS International; Supplier: Avnet; Supplier Part Number: ECS-80-12-33-JGN-TR; Manufacturer Part Number: ECS-80-12-33-JGN-TR; RoHS: No; Stock: 58000; Pricing: 1000=0.27283 (USD); RoHS Compliant: Yes; ComponentLink1URL: https://datasheet.octopart.com/ECS-80-12-33-JGN-TR-ECS-International-datasheet-140089731.pdf?src-supplier=Future+Electronics; ComponentLink1Description: https://datasheet.octopart.com/ECS-80-12-33-JGN-TR-ECS-International-datasheet-140089731.pdf?src-supplier=Future+Electronics; ComponentLink2URL: https://datasheet.octopart.com/ECS-80-12-33-JGN-TR-ECS-International-datasheet-17018741.pdf?src-supplier=Master+Electronics; ComponentLink2Description: https://datasheet.octopart.com/ECS-80-12-33-JGN-TR-ECS-International-datasheet-17018741.pdf?src-supplier=Master+Electronics; Item Type: Crystal